# Altium schematic sheet MCU.SchDoc
size A4; SheetNumber: 2; SheetTotal: 4
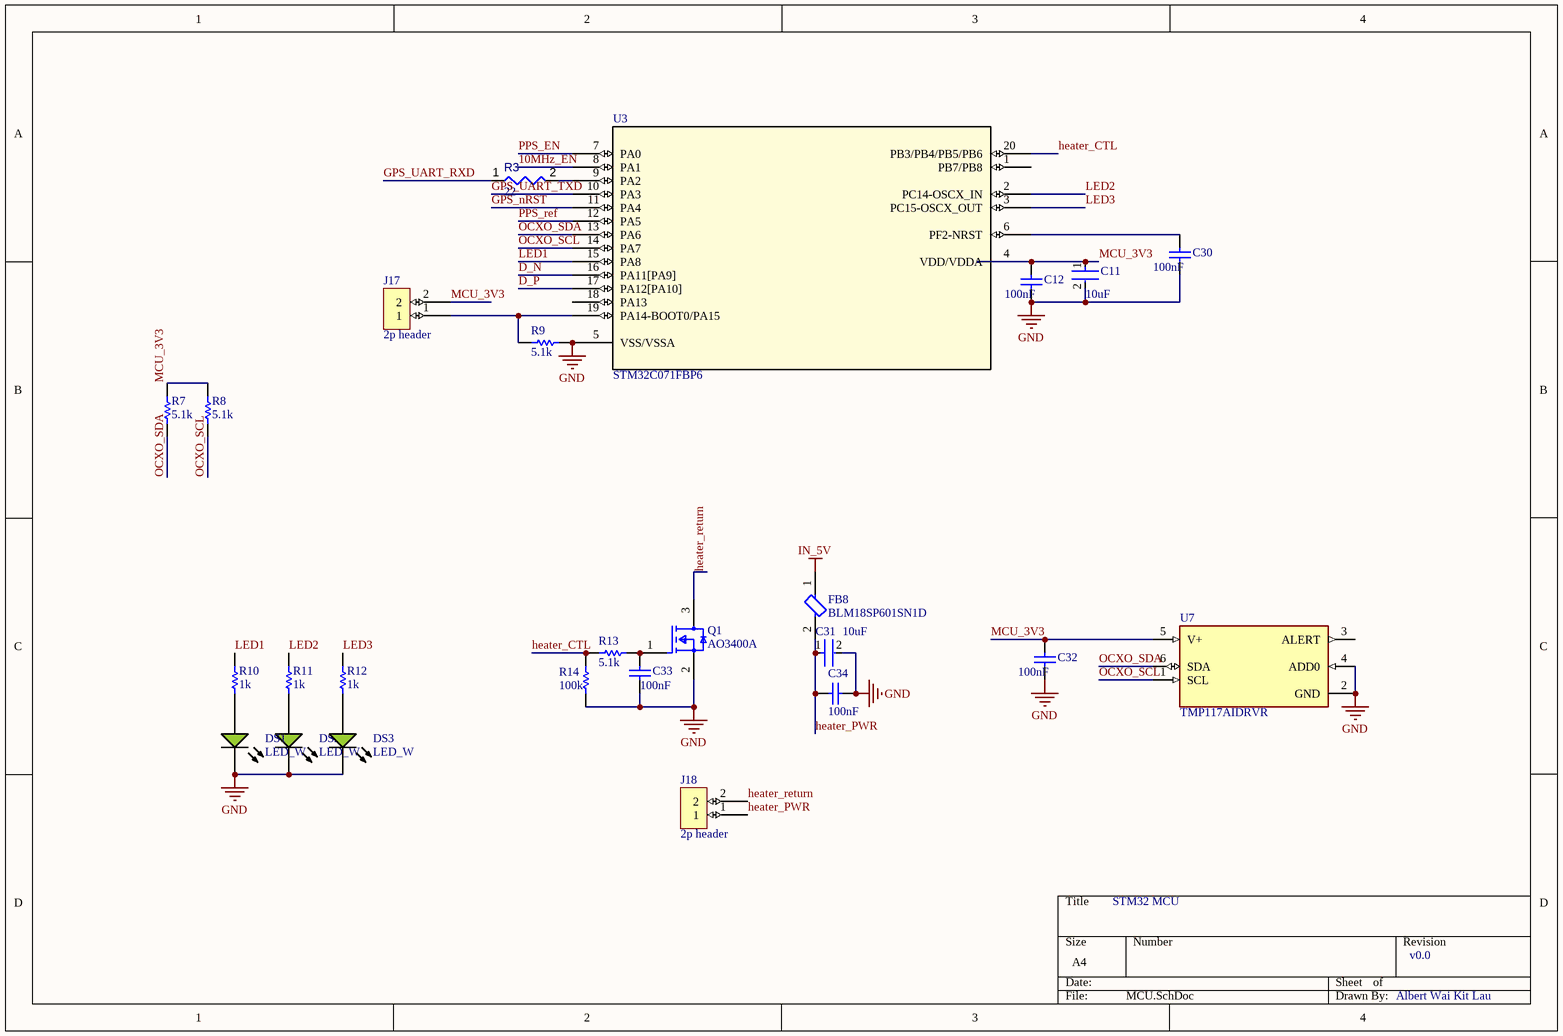
[diagram p0: MCU.SchDoc]

## Parts
C11  10uF  [FP-GRM21B-0_2-e0_2_0_7-IPC_A]
C12  100nF  [CAPC1050X55X23ML05T13]
C30  100nF  [CAPC1050X55X23ML05T13]
C31  10uF  [FP-GRM21B-0_2-e0_2_0_7-IPC_A]
C32  100nF  [CAPC1050X55X23ML05T13]
C33  100nF  [CAPC1050X55X23ML05T13]
C34  100nF  [CAPC1050X55X23ML05T13]
DS1  LED_W  [EVRL-0603-2_V]
DS2  LED_W  [EVRL-0603-2_V]
DS3  LED_W  [EVRL-0603-2_V]
FB8  BLM18SP601SN1D  [FP-BLM18-0_15-t0_8-MFG]
J17  2p header  [New footprint 1]
J18  2p header  [New footprint 1]
Q1  AO3400A  [FP-SOT23-MFG]
R3  value 22  [RESC0402(1005)_L]  (hidden comment: 22R2J)
R7  5.1k  [RESC1005X40X25LL10T10]
R8  5.1k  [RESC1005X40X25LL10T10]
R9  5.1k  [RESC1005X40X25LL10T10]
R10  value 1k  [RESC1005X40X25ML05T05]  (hidden comment: Resistor 1k +/-1% 0402 100 mW)
R11  value 1k  [RESC1005X40X25ML05T05]  (hidden comment: Resistor 1k +/-1% 0402 100 mW)
R12  value 1k  [RESC1005X40X25ML05T05]  (hidden comment: Resistor 1k +/-1% 0402 100 mW)
R13  5.1k  [RESC1005X40X25LL10T10]
R14  100k  [RESC1005X40X25LL10T10]
U3  STM32C071FBP6  [TSSOP20_STM]
U7  TMP117AIDRVR  [FP-DRV0006B-IPC_C]

## Nets
GND: C11.2 C12.2 C30.2 C31.2 C32.2 C33.2 C34.2 DS1.2(K) DS2.2(K) DS3.2(K) Q1.2(S) R9.2 R14.2 U3.5(VSS/VSSA) U7.2(GND) U7.4(ADD0)
IN_5V: FB8.1
10MHz_EN: U3.8(PA1)
D_N: U3.16(PA11[PA9])
D_P: U3.17(PA12[PA10])
GPS_nRST: U3.11(PA4)
GPS_UART_RXD: R3.1
GPS_UART_TXD: U3.10(PA3)
heater_CTL: R13.2 R14.1 U3.20(PB3/PB4/PB5/PB6)
heater_PWR: C31.1 C34.1 FB8.2 J18.1
heater_return: J18.2 Q1.3(D)
LED1: R10.2 U3.15(PA8)
LED2: R11.2 U3.2(PC14-OSCX_IN)
LED3: R12.2 U3.3(PC15-OSCX_OUT)
MCU_3V3: C11.1 C12.1 C32.1 J17.2 R7.2 R8.2 U3.4(VDD/VDDA) U7.5(V+)
OCXO_SCL: R8.1 U3.14(PA7) U7.1(SCL)
OCXO_SDA: R7.1 U3.13(PA6) U7.6(SDA)
PPS_EN: U3.7(PA0)
PPS_ref: U3.12(PA5)
NetC30_1: C30.1 U3.6(PF2-NRST)
NetC33_1: C33.1 Q1.1(G) R13.1
NetDS1_1: DS1.1(A) R10.1
NetDS2_1: DS2.1(A) R11.1
NetDS3_1: DS3.1(A) R12.1
NetJ17_1: J17.1 R9.1 U3.19(PA14-BOOT0/PA15)
NetR3_2: R3.2 U3.9(PA2)

Not connected (* = marked no-connect by the designer): U3 1(PB7/PB8) 18(PA13); U7 3(ALERT)

## Notes on the sheet
- STM32 MCU
- v0.0
- Albert Wai Kit Lau

## Library data of the parts
C11 C31 = CMP-06035-004402-1: Chip Multilayer Ceramic Capacitors for General Purpose, 0805, 10uF, X5R, 15%, 10%, 50V; Voltage Rating (DC): 50V; Dielectric: X5R; Tolerance: 10%; Capacitance: 10uF; Thickness: 1.25mm; Length: 2mm; Width: 1.25mm; JLCPCB: C440198
C12 C30 C32-C34 = CMP-2000-05439-1: Chip Capacitor, 100 nF, +/- 10%, 16 V, -55 to 125 degC, 0402 (1005 Metric), RoHS, Tape and Reel; Manufacturer: Samsung Electro-Mechanics; Capacitance: 100000pF; Dielectric: X7R; Rated Voltage: 16V; Case Size/Dimension: 0402; Tolerance (%): ±10%; Manufacturer URL: http://www.samsungsem.com/global/index.jsp; Datasheet URL: https://datasheet.ciiva.com/29198/458718-da-01-en-vs-kondensator-0402-29198423.pdf; Datasheet Version: Nov-10; JLCPCB: C1525
DS1-DS3 = CMP-007-00002-2: Chip LED, white; Manufacturer: Everlight Electronics; Forward Voltage: 2V; Lens Style: Clear; Viewing Angle: 120degrees; Colour: Green; Mounting Technology: SM; Datasheet Version: Rev. 1, 04/2006; Package Description: 2-Pin Surface Mount Device, Body 1.6 x 0.8 mm; RoHS Compliant: True; Package Reference: 0603; Pins: 2; Manufacturer URL: http://www.everlight.com/; Datasheet URL: https://datasheet.ciiva.com/48679/19-217-g7c-an1p2-3t-48679179.pdf; Case/Package: 0603; JLCPCB: C2290
FB8 = CMP-00260-111572297-1: BLM18SP601SN1D Ferrite Bead, 600 Ohm, 1.5A, 0603 Rohs Compliant: Yes; Resistance: 140mΩ; Test Frequency: 100MHz; Tolerance: 25%; Height: 950µm; Min Operating Temperature: -55°C; NexarPartId: 111572297; Core Material: Ferrite; Max Operating Temperature: 125°C; Case/Package: 0603; Lifecycle Status: Production; Series Resistance: 140mΩ; RMS Current (Irms): 1.5A; JLCPCB: C3716583
J17 J18 = CMP-002-00072-1: simple 2p header
Q1 = CMP-83955-000006-1: MOSFET N-CH 30V 5.7A SOT23; Input Capacitance: 630pF; Number of Elements: 1; Rds On Max: 26.5mR; Max Power Dissipation: 1.4W; Gate to Source Voltage (Vgs): 12V; Min Operating Temperature: -55°C; Lead Free: Lead Free; Number of Pins: 3; Drain to Source Voltage (Vdss): 30V; Case/Package: SOT-23; Mount: Surface Mount; Continuous Drain Current (ID): 5.7A; Radiation Hardening: No; Packaging: Tape and Reel; Max Operating Temperature: 150°C; Power Dissipation: 1.4W; JLCPCB: C20917
R3 = CMP-009-00082-2: 22R 0.063W 5% 0402 (1005 Metric)  SMD; Power: 63mW; Tolerance: 5%; Case/Package: 0402; Pins: 2; Mounting Technology: SMT; JLCPCB: C25092
R7-R9 R13 R14 = CMP-2002-05746-1: Manufacturer: TE Connectivity / AMP; Part Number: CRG0402F5K1
  R7-R9 R13: JLCPCB: C25905
  R14: JLCPCB: C25741
R10-R12 = CMP-009-00009-5: Chip Resistor, 1 KOhm, +/- 1%, 0.1 W, -55 to 155 degC, 0402 (1005 Metric); Power: 100mW; Voltage Rating: 50V; Min Operating Temperature: -55°C; Max Operating Temperature: 155°C; RoHS Compliant: True; Mounting Technology: SM; Pins: 2; Tolerance: 1%; Case/Package: 0402; JLCPCB: C11702
U3 = STM32C071FBP6: Mainstream Arm Cortex-M0+ MCU with 128 Kbytes of Flash memory, 24 Kbytes RAM, 48 MHz CPU, 2x USART, timers, ADC, comm. I/F, USB FS, 2-3.6V; Manufacturer_Name: STMicroelectronics; Copyright: Copyright (C) 2026 Ultra Librarian. All rights reserved.; Manufacturer_Part_Number: STM32C071FBP6; Datasheet: https://www.st.com/resource/en/datasheet/stm32c071c8.pdf; RefDes: RefDes; Type: Type
U7 = CMP-04948-000036-1: TEMPERATURE SENSOR; Resolution: 16b; Output Type: I2C; Packaging: Cut Tape; Mount: Surface Mount; Min Operating Temperature: -55°C; Max Operating Temperature: 150°C; RoHS Compliant: Yes; JLCPCB: C699536